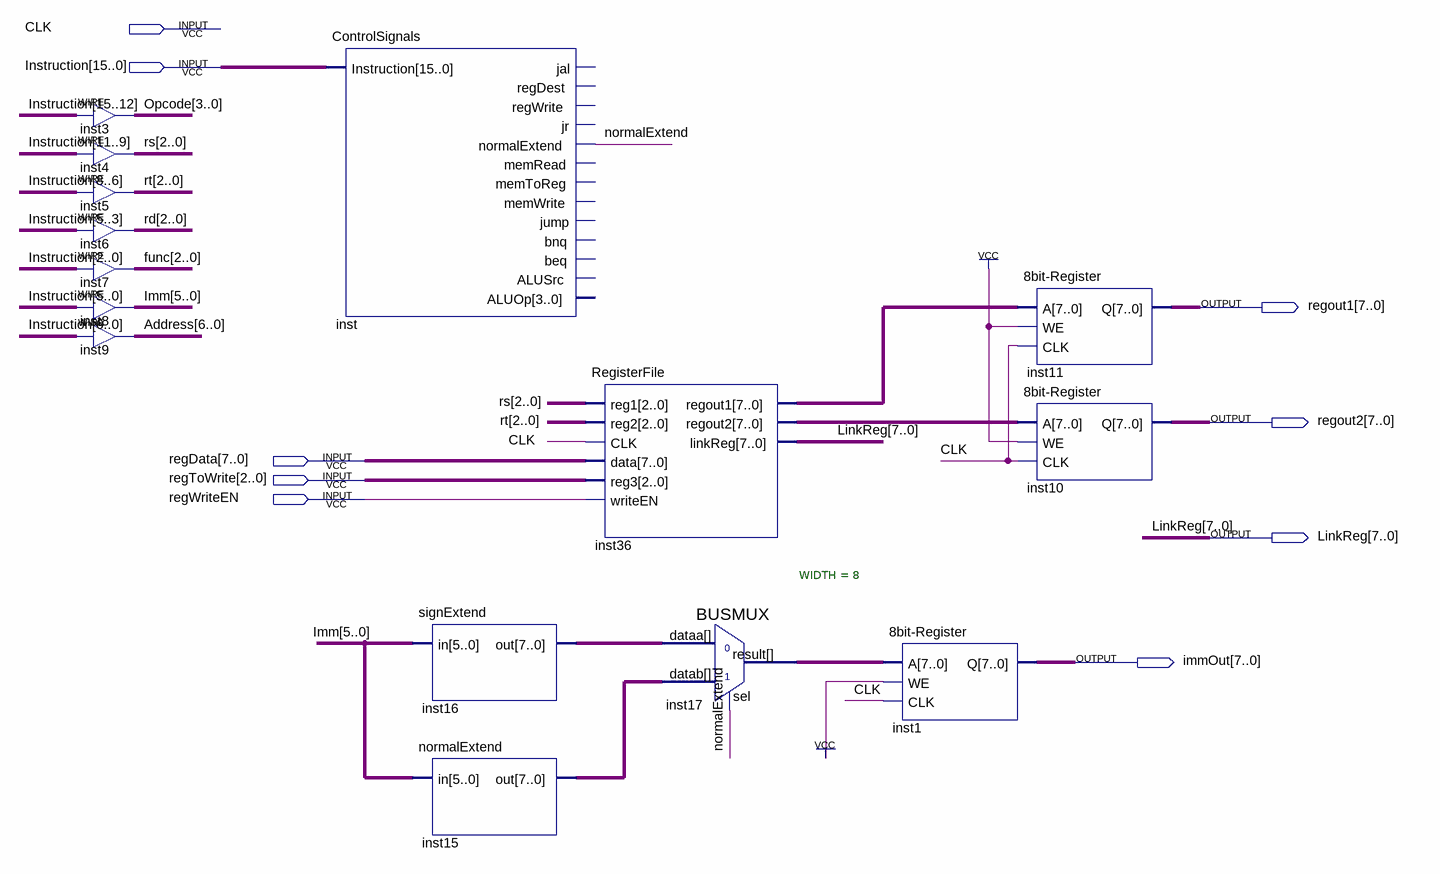
[diagram p0: schematic sheet]
// Quartus schematic ID_RF.bdf as structural Verilog: 15 symbols, 9 pins
module ID_RF (
  input  CLK,
  input  [15:0] Instruction,
  input  [7:0] regData,
  input  [2:0] regToWrite,
  input  regWriteEN,
  output [7:0] regout1,
  output [7:0] regout2,
  output [7:0] LinkReg,
  output [7:0] immOut
);

  wire normalExtend;
  wire [2:0] func, rd, rs, rt;
  wire [3:0] Opcode;
  wire [5:0] Imm;
  wire [6:0] Address;
  wire [7:0] inst15_out, inst16_out, inst17_result, inst36_regout1, inst36_regout2;

  assign Opcode = Instruction[15:12];  // WIRE inst3
  assign rs = Instruction[11:9];  // WIRE inst4
  assign rt = Instruction[8:6];  // WIRE inst5
  assign rd = Instruction[5:3];  // WIRE inst6
  assign func = Instruction[2:0];  // WIRE inst7
  assign Imm = Instruction[5:0];  // WIRE inst8
  assign Address = Instruction[6:0];  // WIRE inst9
  ControlSignals inst (
    .Instruction(Instruction), .normalExtend(normalExtend));  // open: jal, regDest, regWrite, jr, memRead, memToReg, memWrite, jump, bnq, beq, ALUSrc, ALUOp
  signExtend inst16 (.in(Imm), .out(inst16_out));
  normalExtend inst15 (.in(Imm), .out(inst15_out));
  RegisterFile inst36 (
    .reg1(rs), .reg2(rt), .CLK(CLK), .data(regData), .reg3(regToWrite), .writeEN(regWriteEN),
    .regout1(inst36_regout1), .regout2(inst36_regout2), .linkReg(LinkReg));
  BUSMUX #(.WIDTH(8)) inst17 (.datab(inst15_out), .sel(normalExtend), .dataa(inst16_out), .result(inst17_result));
  \8bit-Register  inst1 (.A(inst17_result), .WE(1'b1), .CLK(CLK), .Q(immOut));
  \8bit-Register  inst11 (.A(inst36_regout1), .WE(1'b1), .CLK(CLK), .Q(regout1));
  \8bit-Register  inst10 (.A(inst36_regout2), .WE(1'b1), .CLK(CLK), .Q(regout2));
endmodule
